# Altium project Solar_BMS.PrjPcb
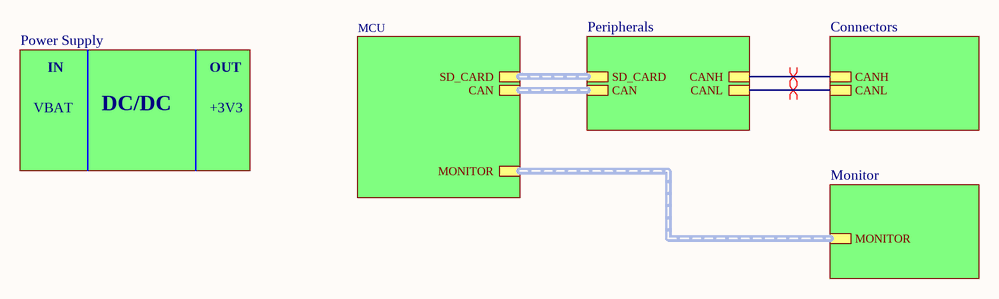
[diagram p0: Main.SchDoc]
6 sheets, 79 parts. Net scope: hierarchical (ports join the sheet entries above them; power ports are global).
Board file: Solar_BMS.PcbDoc
Sheets:
  Main.SchDoc
    Power Supply = PowerSupply.SchDoc
    MCU = MCU.SchDoc
    Peripherals = Peripherals.SchDoc
    Connectors = Connectors.SchDoc
    Monitor = MonitorSchDoc.SchDoc

## Sheet Main.SchDoc
size A4; SheetNumber: 1; SheetTotal: 6

### Sub-sheets
Connectors = Connectors.SchDoc: CANH, CANL
MCU = MCU.SchDoc: SD_CARD (harness SD), MONITOR (harness MONITOR), CAN (harness CAN)
Monitor = MonitorSchDoc.SchDoc: MONITOR (harness MONITOR)
Peripherals = Peripherals.SchDoc: SD_CARD (harness SD), CAN (harness CAN), CANH, CANL
Power Supply = PowerSupply.SchDoc: no entries

### Nets
CANH: sheet Peripherals/CANH, sheet Connectors/CANH
CANL: sheet Peripherals/CANL, sheet Connectors/CANL

### Buses and harness runs
harness sheet MCU/CAN = sheet Peripherals/CAN
harness sheet MCU/MONITOR = sheet Monitor/MONITOR
harness sheet MCU/SD_CARD = sheet Peripherals/SD_CARD

### Layout directives
differential pair: CANH, CANL

### Notes on the sheet
- IN
- VBAT
- DC/DC
- +3V3
- OUT
- Title:
- File name:
- Author:
- Reviewed by:
- Last Update:
- Project name:
- Sheet
- out of

## Sheet PowerSupply.SchDoc
size A4; SheetNumber: 3; SheetTotal: 6
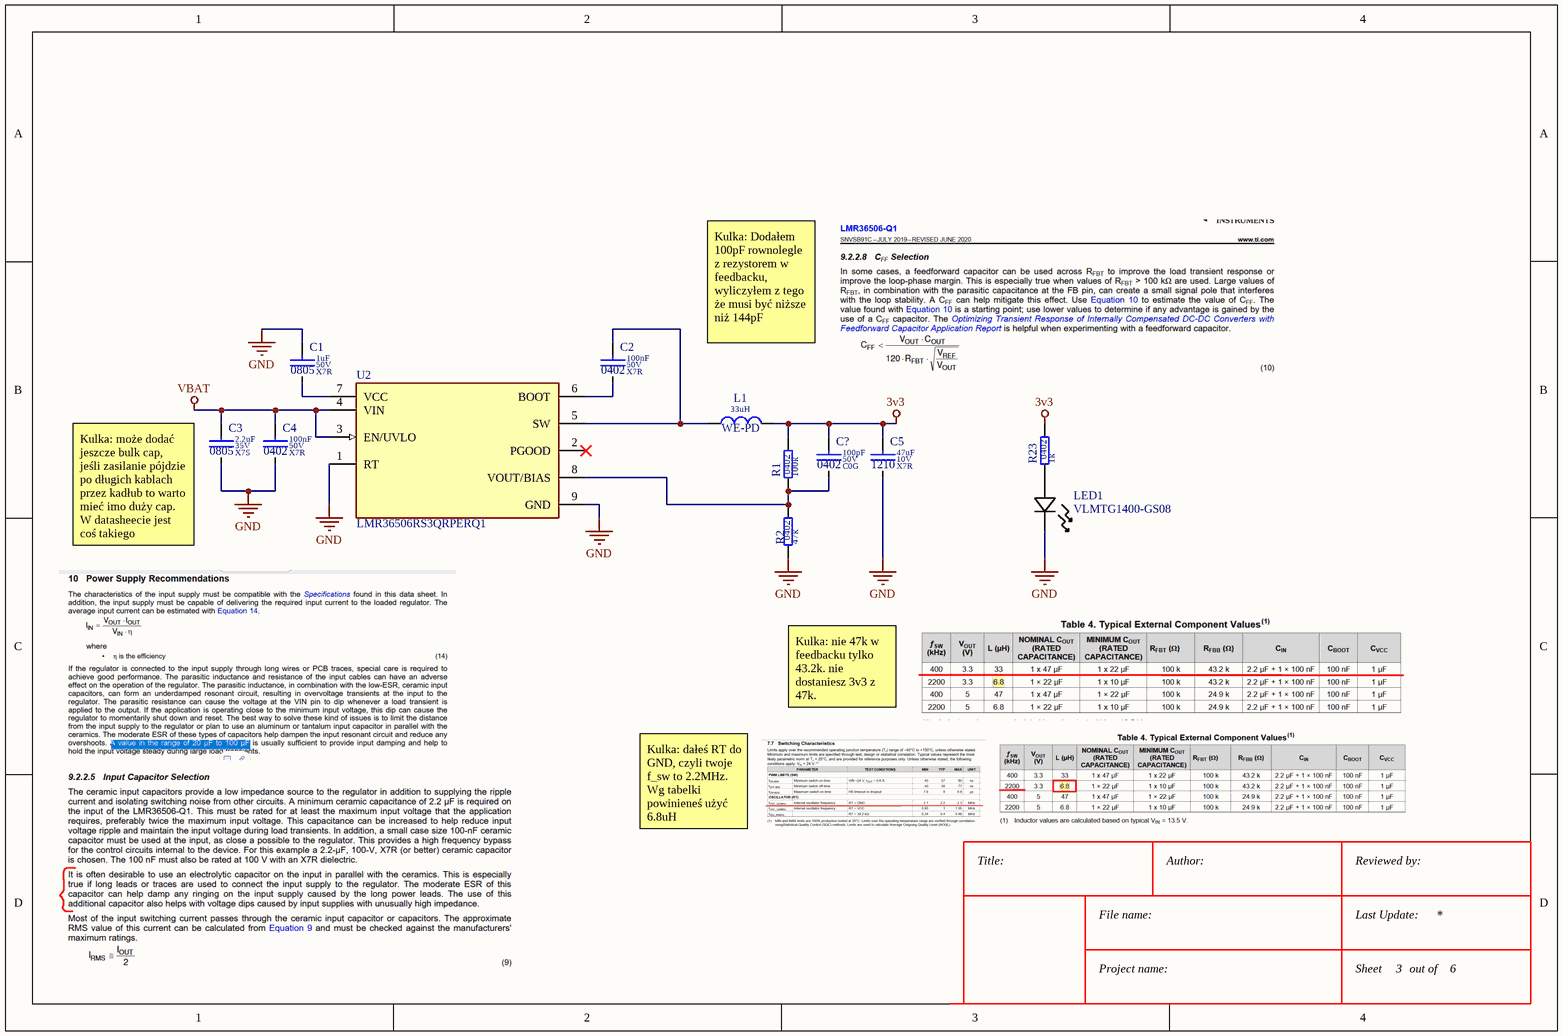
[diagram p1: PowerSupply.SchDoc]

### Parts
(Parts that share a designator on the sheet are numbered #1, #2 ... from top to bottom, then left to right.)
C1  value 1uF  Dielectric: X7R  Voltage: 50V  SCH_Footprint: 0805  [C_0805_2012]  (hidden comment: Ceramic X7R)
C2  value 100nF  Dielectric: X7R  Voltage: 50V  SCH_Footprint: 0402  [C_0402_1005]  (hidden comment: Ceramic X7R)
C3  value 2.2uF  Dielectric: X7S  Voltage: 35V  SCH_Footprint: 0805  [C_0805_2012]  (hidden comment: Ceramic X7S)
C4  value 100nF  Dielectric: X7R  Voltage: 50V  SCH_Footprint: 0402  [C_0402_1005]  (hidden comment: Ceramic X7R)
C5  value 47uF  Dielectric: X7R  Voltage: 10V  SCH_Footprint: 1210  [C_1210_3225]  (hidden comment: Ceramic X7R)
C?#1  value 100pF  Dielectric: C0G  Voltage: 50V  SCH_Footprint: 0402  [C_0402_1005]  (hidden comment: Ceramic C0G)
L1  value 33uH  SCH_Footprint: WE-PD  [WE-PD_1210]  (hidden comment: Inductor)
LED1  VLMTG1400-GS08  [LED_400-GS08_VIS]
R1  value 100k  SCH_Footprint: 0402  [R_0402_1005]  (hidden comment: Resistor)
R2  value 47k  SCH_Footprint: 0402  [R_0402_1005]  (hidden comment: Resistor)
R23  value 1k  SCH_Footprint: 0402  [R_0402_1005]  (hidden comment: Resistor)
U2  LMR36506RS3QRPERQ1  [FP-RPE0009A-MFG]

### Nets
3v3: C5.1 C?#1.1 L1.2 R1.2 R23.2  [project net VDD]
GND: C1.1 C3.2 C4.2 C5.2 LED1.1 R2.1 U2.1(RT) U2.9(GND)
VBAT: C3.1 C4.1 U2.3(EN/UVLO) U2.4(VIN)
NetC1_2: C1.2 U2.7(VCC)
NetC2_1: C2.1 L1.1 U2.5(SW)
NetC2_2: C2.2 U2.6(BOOT)
NetC?#1_2: C?#1.2 R1.1 R2.2 U2.8(VOUT/BIAS)
NetLED1_2: LED1.2 R23.1

Not connected (* = marked no-connect by the designer): U2 2(PGOOD)*

### Notes on the sheet
- Kulka: Dodałem 100pF rownolegle z rezystorem w feedbacku, wyliczyłem z tego że musi być niższe niż 144pF
- (near C3) Kulka: może dodać jeszcze bulk cap,
  jeśli zasilanie pójdzie po długich kablach przez kadłub to warto mieć imo duży cap. W datasheecie jest coś takiego
- Kulka: nie 47k w feedbacku tylko 43.2k. nie dostaniesz 3v3 z 47k.
- Kulka: dałeś RT do GND, czyli twoje f_sw to 2.2MHz. Wg tabelki powinieneś użyć 6.8uH
- Title:
- File name:
- Author:
- Reviewed by:
- Last Update:
- Project name:
- Sheet
- out of

### Library data of the parts
C1 = C_1uF_50V_X7R_0805_10: Capacitor; Manufacturer: AVX; Manufacturer Part Number: 08055C105KAT2A; Tolerance (%): 10; Part Number: C_1uF_50V_X7R_0805_10; HelpURL: https://sigma.octopart.com/147443767/technical_drawing/AVX-08055C105KAT2A.pdf; Supplier 1: TME; Supplier Part Number 1: 08055C105KAT2A; Supplier 2: RS Components; Supplier Part Number 2: 1441427; Supplier 3: Farnell; Supplier Part Number 3: 2094043; Supplier 4: Mouser; Supplier Part Number 4: 581-08055C105KAT2A; Supplier 5: Digi-Key; Supplier Part Number 5: 478-7956-1-ND; Supplier 6: LCSC
C2 C4 = C_100nF_50V_X7R_0402_10: Capacitor; Manufacturer: Murata; Manufacturer Part Number: GRM155R71H104KE14D; Tolerance (%): 10; Part Number: C_100nF_50V_X7R_0402_10; HelpURL: http://docs-europe.electrocomponents.com/webdocs/145f/0900766b8145f9d2.pdf; Supplier 1: TME; Supplier Part Number 1: GRM155R71H104KE14D; Supplier 2: RS Components; Supplier Part Number 2: 8847087; Supplier 3: Farnell; Supplier Part Number 3: 2611912; Supplier 4: Mouser; Supplier Part Number 4: 81-GRM155R71H104KE4D; Supplier 5: Digi-Key; Supplier Part Number 5: 490-10700-1-ND; Supplier 6: LCSC
C3 = C_2.2uF_35V_X7S_0805_10_AECQ1: Capacitor; Manufacturer: Murata; Manufacturer Part Number: GCM21BC7YA225KE02; Tolerance (%): 10; AEC-Q: 1; Part Number: C_2.2uF_35V_X7S_0805_10_AECQ1; HelpURL: https://www.murata.com/products/productdetail?partno=GCM21BC7YA225KE02%23; Supplier 1: TME; Supplier Part Number 1: GCM21BC7YA225KE02L; Supplier 2: RS Components; Supplier 3: Farnell; Supplier Part Number 3: 3784380; Supplier 4: Mouser; Supplier Part Number 4: 81-GCM21BC7YA225KE2L; Supplier 5: Digi-Key; Supplier Part Number 5: 490-16390-1-ND; Supplier 6: LCSC; Supplier Part Number 6: C389007
C5 = C_47uF_10V_X7R_1210_20: Capacitor; Manufacturer: Murata; Manufacturer Part Number: GRM32ER71A476ME15L; Tolerance (%): 20; Part Number: C_47uF_10V_X7R_1210_20; HelpURL: http://www.mouser.com/ds/2/281/c02e-2905.pdf; Supplier 1: TME; Supplier Part Number 1: GRM32ER71A476ME15L; Supplier 2: RS Components; Supplier Part Number 2: 8202908; Supplier 3: Farnell; Supplier Part Number 3: 2362130; Supplier 4: Mouser; Supplier Part Number 4: 81-GRM32ER71A476ME5L; Supplier 5: Digi-Key; Supplier Part Number 5: 490-6543-1-ND; Supplier 6: LCSC
C?#1 = C_100pF_50V_C0G_0402_5: Capacitor; Manufacturer: Murata; Manufacturer Part Number: GRM1555C1H101JA01D; Tolerance (%): 5; Part Number: C_100pF_50V_C0G_0402_5; HelpURL: http://www.tme.eu/en/Document/e3e731e59cc68b1ab6d46b158bb05733/MURATA_GRM.pdf; Supplier 1: TME; Supplier Part Number 1: GRM1555C1H101JA01D; Supplier 2: RS Components; Supplier Part Number 2: 7235363; Supplier 3: Farnell; Supplier Part Number 3: 2218836; Supplier 4: Mouser; Supplier Part Number 4: 81-GRM1555C1H101JA1D; Supplier 5: Digi-Key; Supplier Part Number 5: 490-5922-1-ND; Supplier 6: LCSC
L1 = L_33uH_4.2A_WE-PD: Induction; Manufacturer: Wurth; Manufacturer Part Number: 7447709330; Current: 4.2A; Resistance: 37mR; Part Number: L_33uH_4.2A_WE-PD; HelpURL: https://www.we-online.com/components/products/datasheet/7447709330.pdf; Supplier 1: TME; Supplier 2: RS Components; Supplier Part Number 2: 70996773; Supplier 3: Farnell; Supplier Part Number 3: 2082654; Supplier 4: Mouser; Supplier Part Number 4: 710-7447709330; Supplier 5: Digi-Key; Supplier Part Number 5: 732-1244-1-ND; Supplier 6: LCSC
LED1 = VLMTG1400-GS08: CHIPLED (0603) TRUEGREEN HIGHBRIGHT -e4; Manufacturer_Name: Vishay; Copyright: Copyright (C) 2025 Ultra Librarian. All rights reserved.; Manufacturer_Part_Number: VLMTG1400-GS08
R1 = R_100k_0402_1: Manufacturer: Yageo; Manufacturer Part Number: RC0402FR-07100KL; Voltage: 50V; Power: 63mW; Tolerance: 1%; Part Number: R_100k_0402_1; HelpURL: http://www.tme.eu/pl/Document/1a2bc76e2be68b3b1670068306778ce6/rc0402yageo.pdf; Supplier 1: TME; Supplier Part Number 1: RC0402FR-07100K; Supplier 2: RS Components; Supplier 3: Farnell; Supplier Part Number 3: 2131798; Supplier 4: Mouser; Supplier Part Number 4: 603-RC0402FR-07100KL; Supplier 5: Digi-Key; Supplier Part Number 5: 311-100KLRCT-ND; Supplier 6: LCSC
R2 = R_47k_0402_1: Manufacturer: Yageo; Manufacturer Part Number: RC0402FR-0747KL; Voltage: 50V; Power: 63mW; Tolerance: 1%; Part Number: R_47k_0402_1; HelpURL: https://datasheet.octopart.com/RC0402FR-0747KL-Yageo-datasheet-10408619.pdf; Supplier 1: TME; Supplier Part Number 1: RC0402FR-0747KL; Supplier 2: RS Components; Supplier 3: Farnell; Supplier Part Number 3: 2421898; Supplier 4: Mouser; Supplier Part Number 4: 603-RC0402FR-0747KL; Supplier 5: Digi-Key; Supplier Part Number 5: 311-47.0KLRCT-ND; Supplier 6: LCSC
R23 = R_1k_0402_1: Manufacturer: Yageo; Manufacturer Part Number: RC0402FR-071K; Voltage: 50V; Power: 63mW; Tolerance: 1%; Part Number: R_1k_0402_1; HelpURL: http://www.tme.eu/pl/Document/1a2bc76e2be68b3b1670068306778ce6/rc0402yageo.pdf; Supplier 1: TME; Supplier Part Number 1: RC0402FR-071K; Supplier 2: RS Components; Supplier 3: Farnell; Supplier Part Number 3: 9239235; Supplier 4: Mouser; Supplier Part Number 4: 603-RC0402FR-071KP; Supplier 5: Digi-Key; Supplier Part Number 5: 311-1.00KLRCT-ND; Supplier 6: LCSC
U2 = CMP-04918-000626-1: 3-V TO 65-V, 0.6-A BUCK CONVERTE

## Sheet MCU.SchDoc
size A4; SheetNumber: 5; SheetTotal: 6
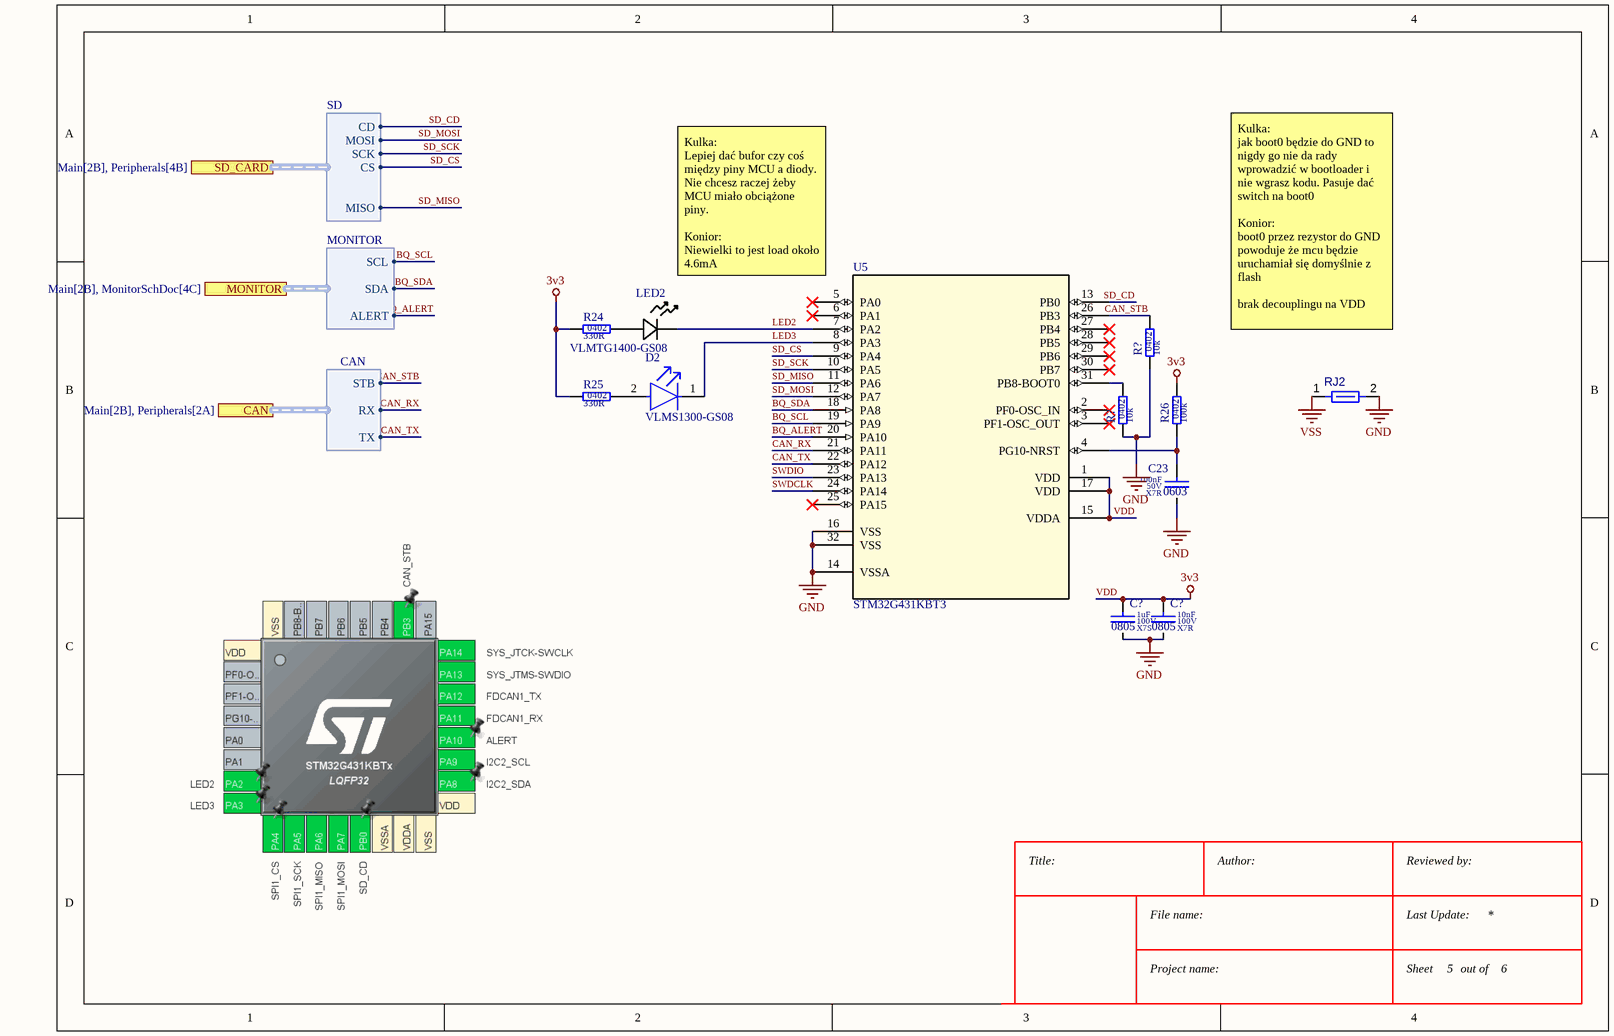
[diagram p2: MCU.SchDoc]

### Parts
(Parts that share a designator on the sheet are numbered #1, #2 ... from top to bottom, then left to right.)
C23  value 100nF  Dielectric: X7R  Voltage: 50V  SCH_Footprint: 0603  [C_0603_1608]  (hidden comment: Ceramic X7R)
C?#2  value 1uF  Dielectric: X7S  Voltage: 100V  SCH_Footprint: 0805  [C_0805_2012]  (hidden comment: Ceramic X7S)
C?#3  value 10nF  Dielectric: X7R  Voltage: 100V  SCH_Footprint: 0805  [C_0805_2012]  (hidden comment: Ceramic X7R)
D2  VLMS1300-GS08  [FP-6_541-5092_01-4-MFG]
LED2  VLMTG1400-GS08  [LED_400-GS08_VIS]
R24  value 330R  SCH_Footprint: 0402  [R_0402_1005]  (hidden comment: Resistor)
R25  value 330R  SCH_Footprint: 0402  [R_0402_1005]  (hidden comment: Resistor)
R26  value 100k  SCH_Footprint: 0402  [R_0402_1005]  (hidden comment: Resistor)
R?#1  value 10k  SCH_Footprint: 0402  [R_0402_1005]  (hidden comment: Resistor)
R?#2  value 10k  SCH_Footprint: 0402  [R_0402_1005]  (hidden comment: Resistor)
RJ2  Net Tie 12x8mil  [SHORT06-FP]  (value not drawn)  (net tie, no BOM)
U5  STM32G431KBT3  [LQFP-32_STM]

### Ports
CAN (harness CAN, see Main[2B], Peripherals[2A]), MONITOR (harness MONITOR, see Main[2B], MonitorSchDoc[4C]), SD_CARD (harness SD, see Main[2B], Peripherals[4B])

### Harnesses
SD: MISO, SCK, MOSI, CD, CS
MONITOR: SDA, ALERT, SCL
CAN: TX, RX, STB

### Nets
GND: C23.2 C?#2.2 C?#3.2 R?#1.1 R?#2.1 RJ2.2 U5.14(VSSA) U5.16(VSS) U5.32(VSS)
VDD: C?#2.1 C?#3.1 R24.1 R25.1 R26.2 U5.1(VDD) U5.15(VDDA) U5.17(VDD)  [also labelled 3v3]
VSS: RJ2.1
BQ_ALERT: U5.20(PA10) ; port MONITOR.ALERT  [project net ALERT]
BQ_SCL: U5.19(PA9) ; port MONITOR.SCL
BQ_SDA: U5.18(PA8) ; port MONITOR.SDA
CAN_RX: U5.21(PA11) ; port CAN.RX
CAN_STB: R?#1.2 U5.26(PB3) ; port CAN.STB
CAN_TX: U5.22(PA12) ; port CAN.TX
LED2: LED2.1 U5.7(PA2)
LED3: D2.1(C) U5.8(PA3)
SD_CD: U5.13(PB0) ; port SD_CARD.CD  [project net CD]
SD_CS: U5.9(PA4) ; port SD_CARD.CS
SD_MISO: U5.11(PA6) ; port SD_CARD.MISO
SD_MOSI: U5.12(PA7) ; port SD_CARD.MOSI
SD_SCK: U5.10(PA5) ; port SD_CARD.SCK
SWDCLK: U5.24(PA14)
SWDIO: U5.23(PA13)
NetC23_1: C23.1 R26.1 U5.4(PG10-NRST)
NetD2_2: D2.2(A) R25.2
NetLED2_2: LED2.2 R24.2
NetR?#2_2: R?#2.2 U5.31(PB8-BOOT0)

Not connected (* = marked no-connect by the designer): U5 2(PF0-OSC_IN)* 3(PF1-OSC_OUT)* 5(PA0)* 6(PA1)* 25(PA15)* 27(PB4)* 28(PB5)* 29(PB6)* 30(PB7)*

### Notes on the sheet
- Kulka:
  Lepiej dać bufor czy coś między piny MCU a diody. Nie chcesz raczej żeby MCU miało obciążone piny.
  Konior:
  Niewielki to jest load około 4.6mA
- Kulka:
  jak boot0 będzie do GND to nigdy go nie da rady wprowadzić w bootloader i nie wgrasz kodu. Pasuje dać switch na boot0
  Konior:
  boot0 przez rezystor do GND powoduje że mcu będzie uruchamiał się domyślnie z flash
  brak decouplingu na VDD
- Title:
- File name:
- Author:
- Reviewed by:
- Last Update:
- Project name:
- Sheet
- out of

### Library data of the parts
C23 = C_100nF_50V_X7R_0603_10_AECQ1: Capacitor; Manufacturer: Murata; Manufacturer Part Number: GCM188R71H104KA57D; Tolerance (%): 10; AEC-Q: 1; Part Number: C_100nF_50V_X7R_0603_10_AECQ1; HelpURL: https://www.murata.com/products/productdetail?partno=GCM188R71H104KA57%23; Supplier 1: TME; Supplier Part Number 1: GCM188R71H104KA57D; Supplier 2: RS Components; Supplier 3: Farnell; Supplier Part Number 3: 4360223; Supplier 4: Mouser; Supplier Part Number 4: 81-GCM188R71H104KA7D; Supplier 5: Digi-Key; Supplier Part Number 5: 490-4779-1-ND; Supplier 6: LCSC; Supplier Part Number 6: C85864
C?#2 = C_1uF_100V_X7S_0805_10_AECQ1: Capacitor; Manufacturer: Murata; Manufacturer Part Number: GCM21BC72A105KE36; Tolerance (%): 10; AEC-Q: 1; Part Number: C_1uF_100V_X7S_0805_10_AECQ1; HelpURL: https://www.murata.com/products/productdetail?partno=GCM21BC72A105KE36%23; Supplier 1: TME; Supplier Part Number 1: GCM21BC72A105KE36L; Supplier 2: RS Components; Supplier 3: Farnell; Supplier Part Number 3: 3243166; Supplier 4: Mouser; Supplier Part Number 4: 81-GCM21BC72A105KE6L; Supplier 5: Digi-Key; Supplier Part Number 5: 490-14436-1-ND; Supplier 6: LCSC; Supplier Part Number 6: C126585
C?#3 = C_10nF_100V_X7R_0805_10_AECQ1: Capacitor; Manufacturer: Murata; Manufacturer Part Number: GCM216R72A103KA37D; Tolerance (%): 10; AEC-Q: 1; Part Number: C_10nF_100V_X7R_0805_10_AECQ1; HelpURL: https://www.murata.com/products/productdetail?partno=GCM216R72A103KA37%23; Supplier 1: TME; Supplier Part Number 1: GCM216R72A103KA37D; Supplier 2: RS Components; Supplier 3: Farnell; Supplier Part Number 3: 4326631; Supplier 4: Mouser; Supplier Part Number 4: 81-GCM216R72A103KA7D; Supplier 5: Digi-Key; Supplier Part Number 5: 490-6060-1-ND; Supplier 6: LCSC; Supplier Part Number 6: C469523
D2 = CMP-02520-000012-1: LED RED 0603 SMD; Manufacturer: Vishay; Forward Voltage: 2V; Reverse Voltage: 5V; Power Dissipation: 75mW; Forward Current: 20mA; Luminous Intensity: 54mcd; Led Orientation: Top View; Peak Emmision Wavelength: 639nm; Viewing Angle: 130°; Wavelength: 631nm; Digikey Description: LED RED 0603 SMD; Height: 1mm; Colour: Red; Ambient Temperature Range High: +85°C; Ambient Temperature Range Low: -35°C; Package: 6.541-5092.01-4; Automotive: No; Temperature Range High: +85°C; Device Class L3: unset; Lead Free: Yes; Temperature Range Low: -35°C; Temperature: -35°C to +85°C; Manufacturer Part Number: VLMS1300-GS08; Device Class L2: LEDs; ComponentLink2Description: Datasheet; Octopart: https://octopart.com/vlms1300-gs08-vishay-21709201; Device Class L1: Optoelectronics; RoHS: TRUE; ComponentLink2URL: http://www.vishay.com/docs/82437/vlmo1300.pdf; Mouser Description: Standard LEDs - SMD Super Red Clear Non-Diff; Category: Diode
LED2 = VLMTG1400-GS08: as LED1 on sheet PowerSupply; Copyright: Copyright (C) 2025 Ultra Librarian. All rights reserved.; Manufacturer_Part_Number: VLMTG1400-GS08
R24 R25 = R_330R_0402_1_AECQ0: Manufacturer: Panasonic; Manufacturer Part Number: ERJ-2RKF3300X; Voltage: 50V; Power: 100mW; Tolerance: 1%; AEC-Q: 0; Part Number: R_330R_0402_1_AECQ0; HelpURL: https://industrial.panasonic.com/cdbs/www-data/pdf/RDA0000/AOA0000C304.pdf; Supplier 1: TME; Supplier Part Number 1: ERJ2RKF3300X; Supplier 2: RS Components; Supplier 3: Farnell; Supplier Part Number 3: 2302581; Supplier 4: Mouser; Supplier Part Number 4: 667-ERJ-2RKF3300X; Supplier 5: Digi-Key; Supplier Part Number 5: P330LCT-ND; Supplier 6: LCSC
R26 = R_100k_0402_1: as R1 on sheet PowerSupply; Part Number: R_100k_0402_1; HelpURL: http://www.tme.eu/pl/Document/1a2bc76e2be68b3b1670068306778ce6/rc0402yageo.pdf; Supplier 1: TME; Supplier Part Number 1: RC0402FR-07100K; Supplier 2: RS Components; Supplier 3: Farnell; Supplier Part Number 3: 2131798; Supplier 4: Mouser; Supplier Part Number 4: 603-RC0402FR-07100KL; Supplier 5: Digi-Key; Supplier Part Number 5: 311-100KLRCT-ND; Supplier 6: LCSC
R?#1 R?#2 = R_10k_0402_1: Manufacturer: Yageo; Manufacturer Part Number: RC0402FR-0710KL; Voltage: 50V; Power: 63mW; Tolerance: 1%; Part Number: R_10k_0402_1; HelpURL: http://www.tme.eu/pl/Document/1a2bc76e2be68b3b1670068306778ce6/rc0402yageo.pdf; Supplier 1: TME; Supplier Part Number 1: RC0402FR-0710K; Supplier 2: RS Components; Supplier 3: Farnell; Supplier 4: Mouser; Supplier 5: Digi-Key; Supplier 6: LCSC
RJ2 = CMP-009-00121-2: Max Operating Temperature: 155°C; Pins: 2; Min Operating Temperature: -55°C
U5 = STM32G431KBT3: Mainstream Arm Cortex-M4 MCU 170 MHz with 128 Kbytes of Flash memory, Math Accelerator, Medium Analog level integration; Manufacturer_Name: STMicroelectronics; Copyright: Copyright (C) 2026 Ultra Librarian. All rights reserved.; Manufacturer_Part_Number: STM32G431KBT3; Datasheet: https://www.st.com/resource/en/datasheet/stm32g431c6.pdf; RefDes: RefDes; Type: Type

## Sheet Peripherals.SchDoc
size A4; SheetNumber: 4; SheetTotal: 6
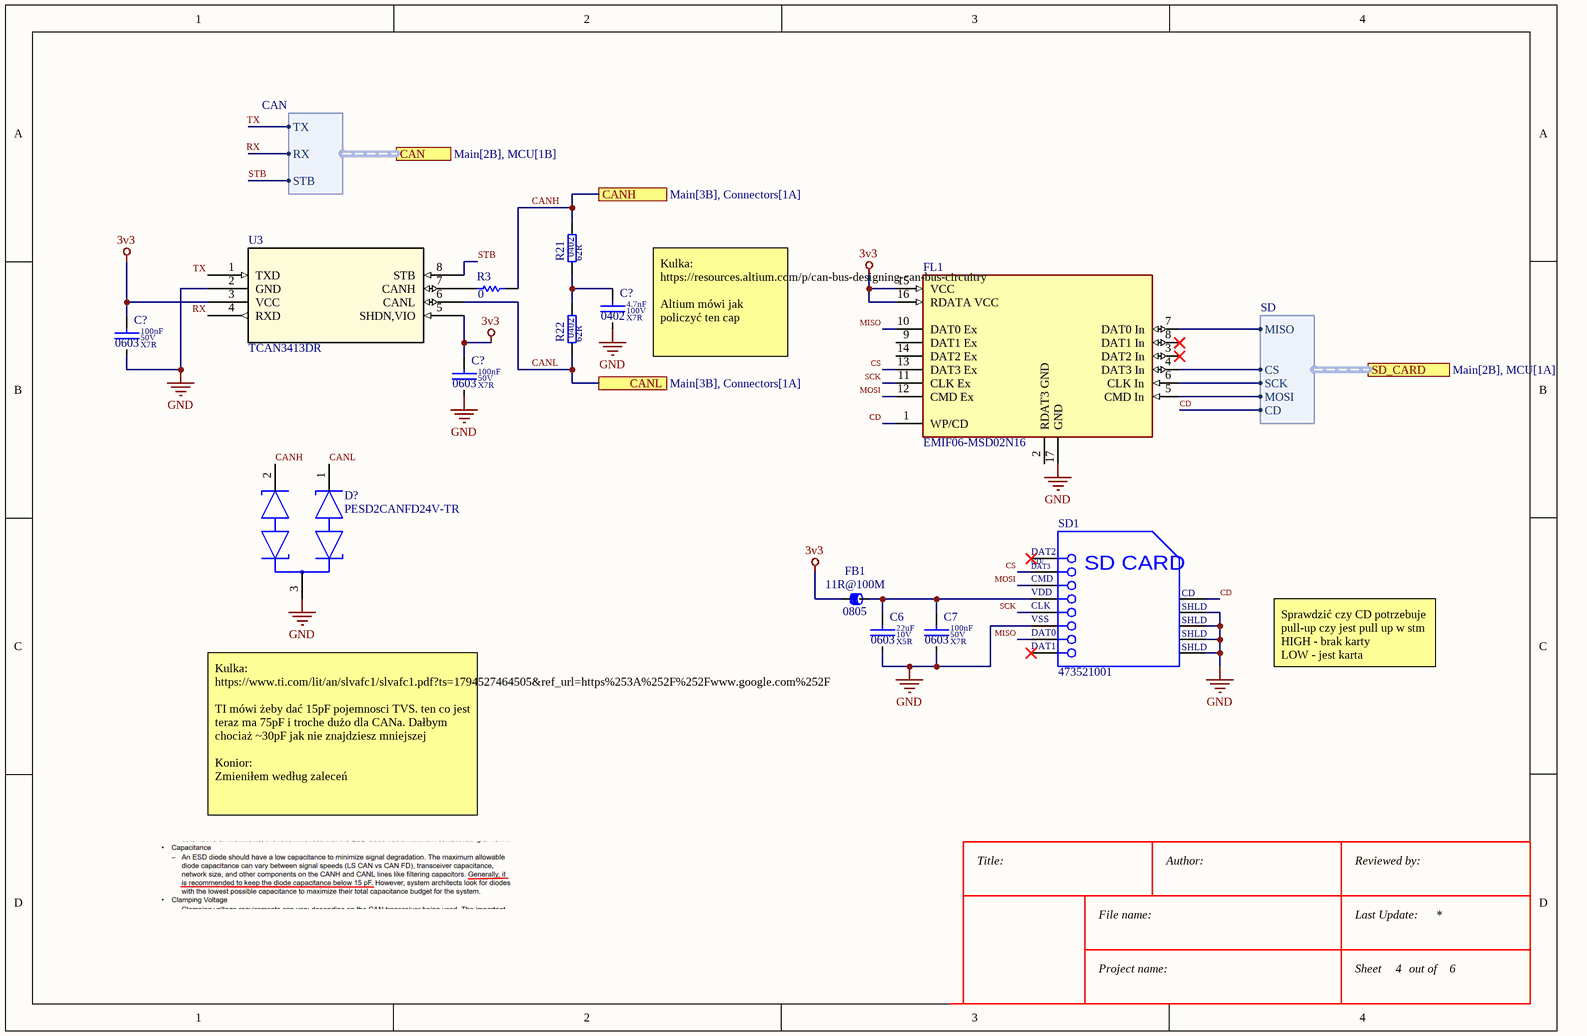
[diagram p3: Peripherals.SchDoc]

### Parts
(Parts that share a designator on the sheet are numbered #1, #2 ... from top to bottom, then left to right.)
C6  value 22uF  Dielectric: X5R  Voltage: 10V  SCH_Footprint: 0603  [C_0603_1608]  (hidden comment: Ceramic X5R)
C7  value 100nF  Dielectric: X7R  Voltage: 50V  SCH_Footprint: 0603  [C_0603_1608]  (hidden comment: Ceramic X7R)
C?#4  value 4.7nF  Dielectric: X7R  Voltage: 100V  SCH_Footprint: 0402  [C_0402_1005]  (hidden comment: Ceramic X7R)
C?#5  value 100nF  Dielectric: X7R  Voltage: 50V  SCH_Footprint: 0603  [C_0603_1608]  (hidden comment: Ceramic X7R)
C?#6  value 100nF  Dielectric: X7R  Voltage: 50V  SCH_Footprint: 0603  [C_0603_1608]  (hidden comment: Ceramic X7R)
D?  PESD2CANFD24V-TR  [FP-SOT23-IPC_A]
FB1  value 11R@100M  SCH_Footprint: 0805  [FB_0805_2012]  (hidden comment: Ferrite bead)
FL1  EMIF06-MSD02N16  [FP-EMIF06-MSD02N16-MFG]
R3  value 0  [RESC1005X40X25ML05T05]  (hidden comment: Resistor 0R +/- 5% 0402 63 mW)
R21  value 62R  SCH_Footprint: 0402  [R_0402_1005]  (hidden comment: Resistor)
R22  value 62R  SCH_Footprint: 0402  [R_0402_1005]  (hidden comment: Resistor)
SD1  473521001  [MOLX-473521001_V]
U3  TCAN3413DR  [SOIC-8_D0008A_TEX]

### Ports
CAN (harness CAN, see Main[2B], MCU[1B]), CANH (see Main[3B], Connectors[1A]), CANL (see Main[3B], Connectors[1A]), SD_CARD (harness SD, see Main[2B], MCU[1A])

### Harnesses
SD: MISO, SCK, MOSI, CD, CS
CAN: TX, RX, STB

### Nets
3v3: C?#5.1 C?#6.1 FB1.1 FL1.15(VCC) FL1.16(RDATA_VCC) U3.3(VCC) U3.5(SHDN,VIO)  [project net VDD]
GND: C6.2 C7.2 C?#4.2 C?#5.2 C?#6.2 D?.3(CC) FL1.17(GND) SD1.6(VSS) SD1.10(SHLD) SD1.11(SHLD) SD1.12(SHLD) SD1.13(SHLD) U3.2(GND)
CANH: D?.2(K2) R3.2 R21.2 ; port CANH
CANL: D?.1(K1) R22.1 U3.6(CANL) ; port CANL
CD: FL1.1(WP/CD) SD1.9(CD) ; port SD_CARD.CD
CS: FL1.13(DAT3_Ex) SD1.2(CD/DAT3)
MISO: FL1.10(DAT0_Ex) SD1.7(DAT0)
MOSI: FL1.12(CMD_Ex) SD1.3(CMD)
RX: U3.4(RXD) ; port CAN.RX  [project net CAN_RX]
SCK: FL1.11(CLK_Ex) SD1.5(CLK)
SD_CS: FL1.4(DAT3_In) ; port SD_CARD.CS
SD_MISO: FL1.7(DAT0_In) ; port SD_CARD.MISO
SD_MOSI: FL1.5(CMD_In) ; port SD_CARD.MOSI
SD_SCK: FL1.6(CLK_In) ; port SD_CARD.SCK
STB: U3.8(STB) ; port CAN.STB  [project net CAN_STB]
TX: U3.1(TXD) ; port CAN.TX  [project net CAN_TX]
NetC6_1: C6.1 C7.1 FB1.2 SD1.4(VDD)
NetC?#4_1: C?#4.1 R21.1 R22.2
NetR3_1: R3.1 U3.7(CANH)

Not connected (* = marked no-connect by the designer): FL1 2(RDAT3_GND) 3(DAT2_In)* 8(DAT1_In)* 9(DAT1_Ex) 14(DAT2_Ex); SD1 1(DAT2)* 8(DAT1)*

### Notes on the sheet
- (near C?#4) Kulka: https://resources.altium.com/p/can-bus-designing-can-bus-circuitry
  Altium mówi jak policzyć ten cap
- Sprawdzić czy CD potrzebuje pull-up czy jest pull up w stm
  HIGH - brak karty
  LOW - jest karta
- Kulka:
  https://www.ti.com/lit/an/slvafc1/slvafc1.pdf?ts=1794527464505&ref_url=https%253A%252F%252Fwww.google.com%252F
  TI mówi żeby dać 15pF pojemnosci TVS. ten co jest teraz ma 75pF i troche dużo dla CANa. Dałbym chociaż ~30pF jak nie znajdziesz mniejszej
  Konior:
  Zmieniłem według zaleceń
- Title:
- File name:
- Author:
- Reviewed by:
- Last Update:
- Project name:
- Sheet
- out of
- (in symbol CMP-2000-05848-1) CD/; DAT3; SD CARD

### Library data of the parts
C6 = C_22uF_10V_X5R_0603_20: Capacitor; Manufacturer: Murata; Manufacturer Part Number: GRM188R61A226ME15D; Tolerance (%): 20; Part Number: C_22uF_10V_X5R_0603_20; HelpURL: https://www.mouser.pl/datasheet/2/281/1/GRM188R61A226ME15_02A-1985787.pdf; Supplier 1: TME; Supplier Part Number 1: GRM188R61A226ME15D; Supplier 2: RS Components; Supplier 3: Farnell; Supplier Part Number 3: 2426957; Supplier 4: Mouser; Supplier Part Number 4: 81-GRM188R61A226ME5D; Supplier 5: Digi-Key; Supplier Part Number 5: 490-10476-1-ND; Supplier 6: LCSC
C7 C?#5 C?#6 = C_100nF_50V_X7R_0603_10_AECQ1: as C23 on sheet MCU; Part Number: C_100nF_50V_X7R_0603_10_AECQ1; HelpURL: https://www.murata.com/products/productdetail?partno=GCM188R71H104KA57%23; Supplier 1: TME; Supplier Part Number 1: GCM188R71H104KA57D; Supplier 2: RS Components; Supplier 3: Farnell; Supplier Part Number 3: 4360223; Supplier 4: Mouser; Supplier Part Number 4: 81-GCM188R71H104KA7D; Supplier 5: Digi-Key; Supplier Part Number 5: 490-4779-1-ND; Supplier 6: LCSC; Supplier Part Number 6: C85864
C?#4 = C_4.7nF_100V_X7R_0402_10: Capacitor; Manufacturer: Murata; Manufacturer Part Number: GRM155R72A472KA01D; Tolerance (%): 10; Part Number: C_4.7nF_100V_X7R_0402_10; HelpURL: https://www.murata.com/en-global/api/pdfdownloadapi?cate=luCeramicCapacitorsSMD&partno=GRM155R72A472KA01%23; Supplier 1: TME; Supplier Part Number 1: GRM155R72A472KA01D; Supplier 2: RS Components; Supplier 3: Farnell; Supplier Part Number 3: 3582820; Supplier 4: Mouser; Supplier Part Number 4: 81-GRM155R72A472KA01; Supplier 5: Digi-Key; Supplier Part Number 5: 490-3885-1-ND; Supplier 6: LCSC; Supplier Part Number 6: C415704
D? = CMP-14436-000014-1: TVS DIODE 24VWM 42VC TO236AB
FB1 = FB_2508051107Y0: Manufacturer: Fair-Rite; Current: 300mA; Resistance: 100mR; Part Number: FB_2508051107Y0; HelpURL: https://datasheet.octopart.com/2508051107Y0-Fair-Rite-datasheet-834.pdf; Manufacturer Part Number: 2508051107Y0; Supplier 1: TME; Supplier 2: RS Components; Supplier 3: Farnell; Supplier Part Number 3: 1612004; Supplier 4: Mouser; Supplier Part Number 4: 623-2508051107Y0; Supplier 5: Digi-Key; Supplier Part Number 5: 1934-1397-1-ND; Supplier 6: LCSC
FL1 = CMP-12221-000004-1: FILTER RC(PI) 45 OHM/20PF SMD; Max Breakdown Voltage: 8V; Number of Channels: 6; Capacitance: 20pF; ESD Protection: Yes; Min Operating Temperature: -30°C; Contact Plating: Gold; Width: 0.047inch; Package Quantity: 1; Length: 3.55mm; Mount: Surface Mount; Breakdown Voltage: 8V; Max Operating Temperature: 85°C; REACH SVHC: No SVHC; Radiation Hardening: No; Depth: 1.25mm; Number of Pins: 16; Height: 0.022inch; Termination: Flat; Packaging: Tape and Reel; Case/Package: QFN; Lead Free: Lead Free
R3 = CMP-009-00003-5: Chip Resistor, 0 Ohm, +/- 5%, 63 mW, -55 to 155 degC, 0402 (1005 Metric); Power: 63mW; Voltage Rating: 50V; RoHS Compliant: True; Max Operating Temperature: 155°C; Mounting Technology: SM; Min Operating Temperature: -55°C; Tolerance: 5%; Case/Package: 0402; Pins: 2
R21 R22 = R_62R_0402_1_AECQ0: Manufacturer: Panasonic; Manufacturer Part Number: ERJ-2RKF62R0X; Voltage: 50V; Power: 100mW; Tolerance: 1%; AEC-Q: 0; Part Number: R_62R_0402_1_AECQ0; HelpURL: https://industrial.panasonic.com/cdbs/www-data/pdf/RDA0000/AOA0000C304.pdf; Supplier 1: TME; Supplier Part Number 1: ERJ2RKF62R0X; Supplier 2: RS Components; Supplier 3: Farnell; Supplier Part Number 3: 4137006; Supplier 4: Mouser; Supplier Part Number 4: 667-ERJ-2RKF62R0X; Supplier 5: Digi-Key; Supplier Part Number 5: P62.0LCT-ND; Supplier 6: LCSC
SD1 = CMP-2000-05848-1: MicroSD(TM), Pitch 1.1 mm, 8 Position, Height 1.88 mm, -20 to 85 degC, RoHS, Tape and Reel; Manufacturer: Molex; Datasheet Version: Rev. G, 01/2012; Datasheet URL: http://www.molex.com/pdm_docs/sd/473521001_sd.pdf; Package Reference: 473521001; Manufacturer URL: http://www.molex.com/; Mounting Technology: SurfaceMount; Package Description: MicroSD(TM), Pitch 1.1 mm, 8 Position, Height 1.88 mm
U3 = TCAN3413DR: 3.3-V CAN FD transceiver with flexible IO and standby mode 8-SOIC -40 to 125; Manufacturer_Name: Texas Instruments; Copyright: Copyright (C) 2026 Ultra Librarian. All rights reserved.; Manufacturer_Part_Number: TCAN3413DR; Datasheet: https://www.ti.com/lit/gpn/tcan3413; RefDes: RefDes; Type: Type

## Sheet Connectors.SchDoc
size A4; SheetNumber: 6; SheetTotal: 6
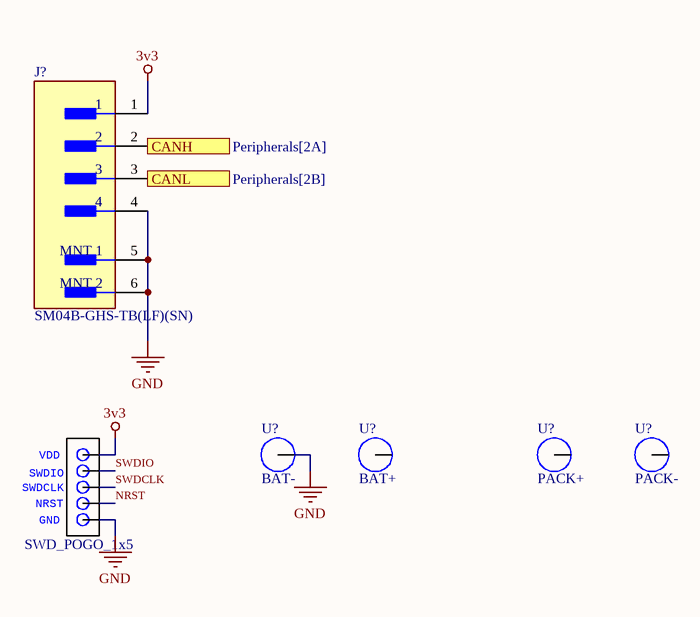
[diagram p4: Connectors.SchDoc]

### Parts
(Parts that share a designator on the sheet are numbered #1, #2 ... from top to bottom, then left to right.)
?  SWD_POGO_1x5  [SWD_pogo_program]
J?  SM04B-GHS-TB(LF)(SN)  [FP-SM04B-GHS-TB_LF_SN-MFG]
U?#1  BAT-
U?#2  BAT+
U?#3  PACK+
U?#4  PACK-

### Ports
CANH (see Peripherals[2A]), CANL (see Peripherals[2B])

### Nets
3v3: J?.1  [project net VDD]
GND: J?.4 J?.5(MNT_1) J?.6(MNT_2) U?#1.1
CANH: J?.2 ; port CANH
CANL: J?.3 ; port CANL

Not connected (* = marked no-connect by the designer): ? 1 2 3 4 5; U?#2 1; U?#3 1; U?#4 1

### Notes on the sheet
- Title:
- File name:
- Author:
- Reviewed by:
- Last Update:
- Project name:
- Sheet
- out of
- (in symbol SWD_POGO_1x5) VDD; SWDIO; SWDCLK; NRST; GND

### Library data of the parts
J? = f4320a1371cd6270e33bce1916c33c0: Connector Header, GH Series, 4 Position, 1.25mm, 30-26 AWG, 50V, Surface Mount, Right Angle, Solder, Locking Ramp
U?#1-U?#4 = PowerPad: Value: *; HelpURL: *; MPN: *; classname: *

## Sheet MonitorSchDoc.SchDoc
size A4; SheetNumber: 2; SheetTotal: 6
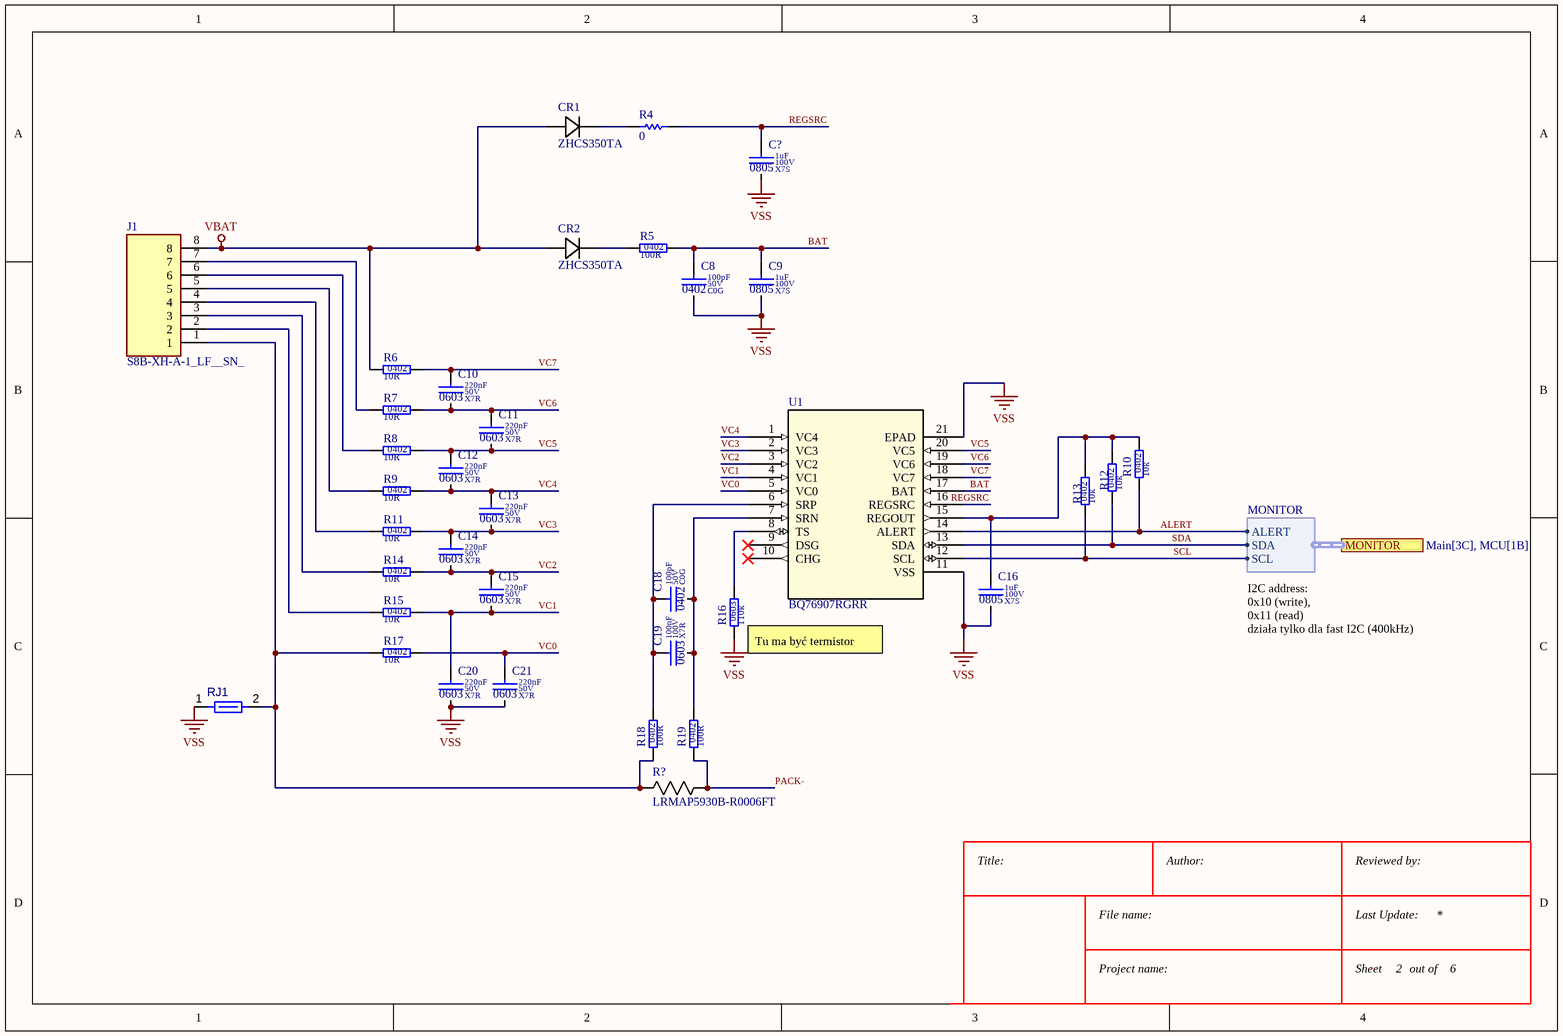
[diagram p5: MonitorSchDoc.SchDoc]

### Parts
(Parts that share a designator on the sheet are numbered #1, #2 ... from top to bottom, then left to right.)
C8  value 100pF  Dielectric: C0G  Voltage: 50V  SCH_Footprint: 0402  [C_0402_1005]  (hidden comment: Ceramic C0G)
C9  value 1uF  Dielectric: X7S  Voltage: 100V  SCH_Footprint: 0805  [C_0805_2012]  (hidden comment: Ceramic X7S)
C10  value 220nF  Dielectric: X7R  Voltage: 50V  SCH_Footprint: 0603  [C_0603_1608]  (hidden comment: Ceramic X7R)
C11  value 220nF  Dielectric: X7R  Voltage: 50V  SCH_Footprint: 0603  [C_0603_1608]  (hidden comment: Ceramic X7R)
C12  value 220nF  Dielectric: X7R  Voltage: 50V  SCH_Footprint: 0603  [C_0603_1608]  (hidden comment: Ceramic X7R)
C13  value 220nF  Dielectric: X7R  Voltage: 50V  SCH_Footprint: 0603  [C_0603_1608]  (hidden comment: Ceramic X7R)
C14  value 220nF  Dielectric: X7R  Voltage: 50V  SCH_Footprint: 0603  [C_0603_1608]  (hidden comment: Ceramic X7R)
C15  value 220nF  Dielectric: X7R  Voltage: 50V  SCH_Footprint: 0603  [C_0603_1608]  (hidden comment: Ceramic X7R)
C16  value 1uF  Dielectric: X7S  Voltage: 100V  SCH_Footprint: 0805  [C_0805_2012]  (hidden comment: Ceramic X7S)
C18  value 100pF  Dielectric: C0G  Voltage: 50V  SCH_Footprint: 0402  [C_0402_1005]  (hidden comment: Ceramic C0G)
C19  value 100nF  Dielectric: X7R  Voltage: 100V  SCH_Footprint: 0603  [C_0603_1608]  (hidden comment: Ceramic X7R)
C20  value 220nF  Dielectric: X7R  Voltage: 50V  SCH_Footprint: 0603  [C_0603_1608]  (hidden comment: Ceramic X7R)
C21  value 220nF  Dielectric: X7R  Voltage: 50V  SCH_Footprint: 0603  [C_0603_1608]  (hidden comment: Ceramic X7R)
C?#7  value 1uF  Dielectric: X7S  Voltage: 100V  SCH_Footprint: 0805  [C_0805_2012]  (hidden comment: Ceramic X7S)
CR1  ZHCS350TA  [CR_350TA_DIO]
CR2  ZHCS350TA  [CR_350TA_DIO]
J1  S8B-XH-A-1_LF__SN_  [S8BXHA1LFSN]
R4  value 0  [RESC1005X40X25ML05T05]  (hidden comment: Resistor 0R +/- 5% 0402 63 mW)
R5  value 100R  SCH_Footprint: 0402  [R_0402_1005]  (hidden comment: Resistor)
R6  value 10R  SCH_Footprint: 0402  [R_0402_1005]  (hidden comment: Resistor)
R7  value 10R  SCH_Footprint: 0402  [R_0402_1005]  (hidden comment: Resistor)
R8  value 10R  SCH_Footprint: 0402  [R_0402_1005]  (hidden comment: Resistor)
R9  value 10R  SCH_Footprint: 0402  [R_0402_1005]  (hidden comment: Resistor)
R10  value 10k  SCH_Footprint: 0402  [R_0402_1005]  (hidden comment: Resistor)
R11  value 10R  SCH_Footprint: 0402  [R_0402_1005]  (hidden comment: Resistor)
R12  value 10k  SCH_Footprint: 0402  [R_0402_1005]  (hidden comment: Resistor)
R13  value 10k  SCH_Footprint: 0402  [R_0402_1005]  (hidden comment: Resistor)
R14  value 10R  SCH_Footprint: 0402  [R_0402_1005]  (hidden comment: Resistor)
R15  value 10R  SCH_Footprint: 0402  [R_0402_1005]  (hidden comment: Resistor)
R16  value 110k  SCH_Footprint: 0603  [R_0603_1608]  (hidden comment: Resistor)
R17  value 10R  SCH_Footprint: 0402  [R_0402_1005]  (hidden comment: Resistor)
R18  value 100R  SCH_Footprint: 0402  [R_0402_1005]  (hidden comment: Resistor)
R19  value 100R  SCH_Footprint: 0402  [R_0402_1005]  (hidden comment: Resistor)
R?#3  LRMAP5930B-R0006FT  [RES_R0006FT_WEL]
RJ1  Net Tie 12x8mil  [SHORT06-FP]  (value not drawn)  (net tie, no BOM)
U1  BQ76907RGRR  [VQFN20_RGR_TEX]

### Ports
MONITOR (harness MONITOR, see Main[3C], MCU[1B])

### Harnesses
MONITOR: SDA, SCL, ALERT

### Nets
VBAT: CR1.2 CR2.2 J1.8 R6.1
VSS: C8.2 C9.2 C16.2 C20.2 C21.2 C?#7.2 R16.1 RJ1.1 U1.11(VSS) U1.21(EPAD)
ALERT: R10.1 U1.14(ALERT) ; port MONITOR.ALERT
BAT: C8.1 C9.1 R5.2 U1.17(BAT)
PACK-: R19.1 R?#3.2
REGSRC: C?#7.1 R4.2 U1.16(REGSRC)
SCL: R13.1 U1.12(SCL) ; port MONITOR.SCL  [project net BQ_SCL]
SDA: R12.1 U1.13(SDA) ; port MONITOR.SDA  [project net BQ_SDA]
VC0: C21.1 R17.2 U1.5(VC0)
VC1: C15.2 C20.1 R15.2 U1.4(VC1)
VC2: C14.2 C15.1 R14.2 U1.3(VC2)
VC3: C13.2 C14.1 R11.2 U1.2(VC3)
VC4: C12.2 C13.1 R9.2 U1.1(VC4)
VC5: C11.2 C12.1 R8.2 U1.20(VC5)
VC6: C10.2 C11.1 R7.2 U1.19(VC6)
VC7: C10.1 R6.2 U1.18(VC7)
NetC16_1: C16.1 R10.2 R12.2 R13.2 U1.15(REGOUT)
NetC18_1: C18.1 C19.1 R18.2 U1.6(SRP)
NetC18_2: C18.2 C19.2 R19.2 U1.7(SRN)
NetCR1_1: CR1.1 R4.1
NetCR2_1: CR2.1 R5.1
NetJ1_1: J1.1 R17.1 R18.1 R?#3.1 RJ1.2
NetJ1_2: J1.2 R15.1
NetJ1_3: J1.3 R14.1
NetJ1_4: J1.4 R11.1
NetJ1_5: J1.5 R9.1
NetJ1_6: J1.6 R8.1
NetJ1_7: J1.7 R7.1
NetR16_2: R16.2 U1.8(TS)

Not connected (* = marked no-connect by the designer): U1 9(DSG)* 10(CHG)*

### Notes on the sheet
- (near R16) Tu ma być termistor
- I2C address:
  0x10 (write),
  0x11 (read)
  działa tylko dla fast I2C (400kHz)
- Title:
- File name:
- Author:
- Reviewed by:
- Last Update:
- Project name:
- Sheet
- out of

### Library data of the parts
C8 C18 = C_100pF_50V_C0G_0402_5: as C?#1 on sheet PowerSupply; Part Number: C_100pF_50V_C0G_0402_5; HelpURL: http://www.tme.eu/en/Document/e3e731e59cc68b1ab6d46b158bb05733/MURATA_GRM.pdf; Supplier 1: TME; Supplier Part Number 1: GRM1555C1H101JA01D; Supplier 2: RS Components; Supplier Part Number 2: 7235363; Supplier 3: Farnell; Supplier Part Number 3: 2218836; Supplier 4: Mouser; Supplier Part Number 4: 81-GRM1555C1H101JA1D; Supplier 5: Digi-Key; Supplier Part Number 5: 490-5922-1-ND; Supplier 6: LCSC
C9 C16 C?#7 = C_1uF_100V_X7S_0805_10_AECQ1: as C?#2 on sheet MCU; Part Number: C_1uF_100V_X7S_0805_10_AECQ1; HelpURL: https://www.murata.com/products/productdetail?partno=GCM21BC72A105KE36%23; Supplier 1: TME; Supplier Part Number 1: GCM21BC72A105KE36L; Supplier 2: RS Components; Supplier 3: Farnell; Supplier Part Number 3: 3243166; Supplier 4: Mouser; Supplier Part Number 4: 81-GCM21BC72A105KE6L; Supplier 5: Digi-Key; Supplier Part Number 5: 490-14436-1-ND; Supplier 6: LCSC; Supplier Part Number 6: C126585
C10-C15 C20 C21 = C_220nF_50V_X7R_0603_10_AECQ1: Capacitor; Manufacturer: Murata; Manufacturer Part Number: GCM188R71H224KA64J; Tolerance (%): 10; AEC-Q: 1; Part Number: C_220nF_50V_X7R_0603_10_AECQ1; HelpURL: https://www.murata.com/products/productdetail?partno=GCM188R71H224KA64%23; Supplier 1: TME; Supplier Part Number 1: GCM188R71H224KA64J; Supplier 2: RS Components; Supplier 3: Farnell; Supplier Part Number 3: 3790391; Supplier 4: Mouser; Supplier Part Number 4: 81-GCM188R71H224KA4J; Supplier 5: Digi-Key; Supplier Part Number 5: 490-13307-1-ND; Supplier 6: LCSC; Supplier Part Number 6: C2169489
C19 = C_100nF_100V_X7R_0603_10: Capacitor; Manufacturer: Kemet; Manufacturer Part Number: C0603X104K1RACTU; Tolerance (%): 10; Part Number: C_100nF_100V_X7R_0603_10; HelpURL: https://www.mouser.pl/datasheet/2/447/KEM_C1013_X7R_FT_CAP_SMD-3316633.pdf; Supplier 1: TME; Supplier 2: RS Components; Supplier 3: Farnell; Supplier Part Number 3: 4380077; Supplier 4: Mouser; Supplier Part Number 4: 80-C0603X104K1RACTU; Supplier 5: Digi-Key; Supplier Part Number 5: 399-C0603X104K1RACTUCT-ND; Supplier 6: LCSC
CR1 CR2 = ZHCS350TA: Description; Manufacturer_Name: Diodes Inc; Copyright: Copyright (C) 2026 Ultra Librarian. All rights reserved.; Manufacturer_Part_Number: ZHCS350TA
J1 = S8B-XH-A-1_LF__SN_: Connector; Manufacturer_Name: JST (JAPAN SOLDERLESS TERMINALS); Manufacturer_Part_Number: S8B-XH-A-1(LF)(SN); Datasheet Link: http://www.jst-mfg.com/product/pdf/eng/eXH.pdf; Height: 6.1mm; Mouser Part Number: 306-S8BXHA1LFSN; Mouser Price/Stock: https://www.mouser.co.uk/ProductDetail/JST-Commercial/S8B-XH-A-1LFSN?qs=QpmGXVUTftFKLlmLzIYjBQ%3D%3D; Arrow Part Number: S8B-XH-A-1(LF)(SN); Arrow Price/Stock: https://www.arrow.com/en/products/s8b-xh-a-1-lf-sn/jst-manufacturing?region=europe
R4 = CMP-009-00003-5: as R3 on sheet Peripherals; RoHS Compliant: True; Max Operating Temperature: 155°C; Mounting Technology: SM; Min Operating Temperature: -55°C; Tolerance: 5%; Case/Package: 0402; Pins: 2
R5 R18 R19 = R_100R_0402_1_AECQ0: Manufacturer: Panasonic; Manufacturer Part Number: ERJ-2RKF1000X; Voltage: 50V; Power: 100mW; Tolerance: 1%; AEC-Q: 0; Part Number: R_100R_0402_1_AECQ0; HelpURL: https://industrial.panasonic.com/cdbs/www-data/pdf/RDA0000/AOA0000C304.pdf; Supplier 1: TME; Supplier Part Number 1: ERJ2RKF1000X; Supplier 2: RS Components; Supplier 3: Farnell; Supplier Part Number 3: 2302528; Supplier 4: Mouser; Supplier Part Number 4: 667-ERJ-2RKF1000X; Supplier 5: Digi-Key; Supplier Part Number 5: P100LCT-ND; Supplier 6: LCSC
R6-R9 R11 R14 R15 R17 = R_10R_0402_1: Manufacturer: Yageo; Manufacturer Part Number: RC0402FR-0710R; Voltage: 50V; Power: 63mW; Tolerance: 1%; Part Number: R_10R_0402_1; HelpURL: http://www.tme.eu/pl/Document/1a2bc76e2be68b3b1670068306778ce6/rc0402yageo.pdf; Supplier 1: TME; Supplier Part Number 1: RC0402FR-0710R; Supplier 2: RS Components; Supplier Part Number 2: 6185848; Supplier 3: Farnell; Supplier Part Number 3: 2128710; Supplier 4: Mouser; Supplier Part Number 4: 603-RC0402FR-0710RL; Supplier 5: Digi-Key; Supplier Part Number 5: 311-10.0LRCT-ND; Supplier 6: LCSC
R10 R12 R13 = R_10k_0402_1: as R?#1 on sheet MCU; Part Number: R_10k_0402_1; HelpURL: http://www.tme.eu/pl/Document/1a2bc76e2be68b3b1670068306778ce6/rc0402yageo.pdf; Supplier 1: TME; Supplier Part Number 1: RC0402FR-0710K; Supplier 2: RS Components; Supplier 3: Farnell; Supplier 4: Mouser; Supplier 5: Digi-Key; Supplier 6: LCSC
R16 = R_110k_0603_1: Manufacturer: Royalohm; Manufacturer Part Number: 0603SAF1103T5E; Voltage: 50V; Power: 100mW; Tolerance: 1%; Part Number: R_110k_0603_1; HelpURL: http://www.tme.eu/pl/Document/9e42ba54d36a9bd3dfa2901986ac022d/rezystor-smd.pdf; Supplier 1: TME; Supplier Part Number 1: SMD0603-110K-1%; Supplier 2: RS Components; Supplier 3: Farnell; Supplier Part Number 3: 2845762; Supplier 4: Mouser; Supplier 5: Digi-Key; Supplier 6: LCSC
R?#3 = LRMAP5930B-R0006FT: Description; Manufacturer_Name: TT Electronics; Copyright: Copyright (C) 2025 Ultra Librarian. All rights reserved.; Manufacturer_Part_Number: LRMAP5930B-R0006FT
RJ1 = CMP-009-00121-2: Max Operating Temperature: 155°C; Pins: 2; Min Operating Temperature: -55°C
U1 = BQ76907RGRR: Low-power monitor and protector for 2S to 7S with high accuracy cell voltage measurement 20-VQFN -40 to 110; Manufacturer_Name: Texas Instruments; Type: Power Management; Copyright: Copyright (C) 2026 Ultra Librarian. All rights reserved.; Manufacturer_Part_Number: BQ76907RGRR; RefDes: RefDes

## Nets that join several sheets
GND: PowerSupply (8 pins), MCU (9 pins), Peripherals (13 pins), Connectors (J?.4 J?.5 J?.6 U?#1.1)
VBAT: PowerSupply (C3.1 C4.1 U2.3 U2.4), MonitorSchDoc (CR1.2 CR2.2 J1.8 R6.1)
VDD: PowerSupply (5 pins), MCU (8 pins), Peripherals (7 pins), Connectors (J?.1)
VSS: MCU (RJ2.1), MonitorSchDoc (10 pins)
ALERT: MCU (U5.20), MonitorSchDoc (R10.1 U1.14)
BQ_SCL: MCU (U5.19), MonitorSchDoc (R13.1 U1.12)
BQ_SDA: MCU (U5.18), MonitorSchDoc (R12.1 U1.13)
CAN_RX: MCU (U5.21), Peripherals (U3.4)
CAN_STB: MCU (R?#1.2 U5.26), Peripherals (U3.8)
CAN_TX: MCU (U5.22), Peripherals (U3.1)
CANH: Peripherals (D?.2 R3.2 R21.2), Connectors (J?.2)
CANL: Peripherals (D?.1 R22.1 U3.6), Connectors (J?.3)
CD: MCU (U5.13), Peripherals (FL1.1 SD1.9)
SD_CS: MCU (U5.9), Peripherals (FL1.4)
SD_MISO: MCU (U5.11), Peripherals (FL1.7)
SD_MOSI: MCU (U5.12), Peripherals (FL1.5)
SD_SCK: MCU (U5.10), Peripherals (FL1.6)